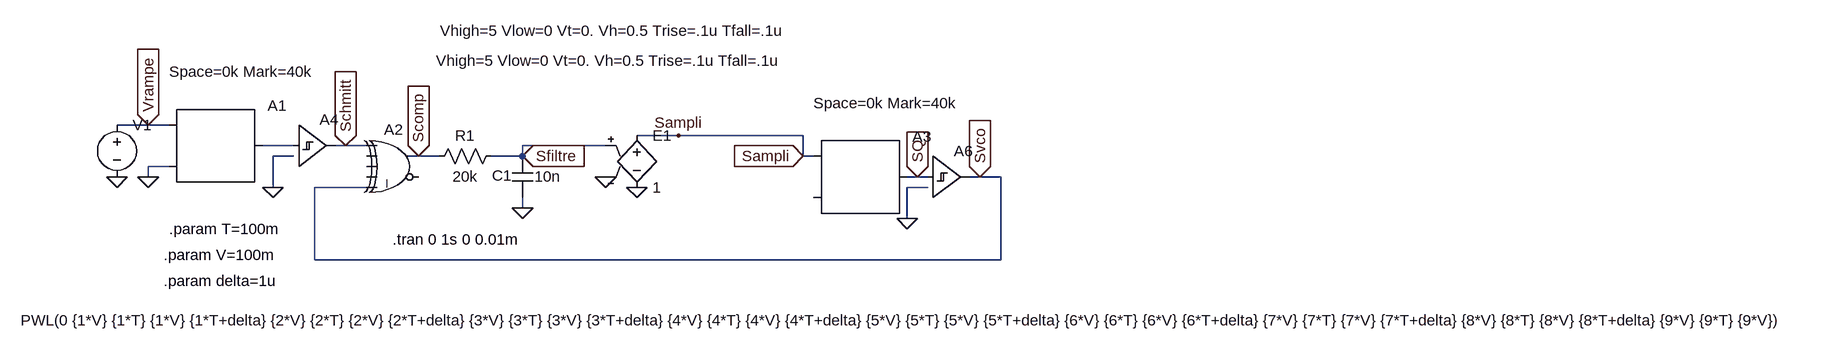
[diagram p0: schematic DQ16Rampe de tension discrete.asc]
DQ16Rampe de tension discrete.asc, the LTspice schematic file:
Version 4.1
SHEET 1 3036 680
WIRE -272 48 -320 48
WIRE -240 48 -272 48
WIRE 544 64 480 64
WIRE 736 64 544 64
WIRE -48 80 -96 80
WIRE 32 80 16 80
WIRE 64 80 32 80
WIRE 432 80 304 80
WIRE -48 96 -80 96
WIRE 144 96 128 96
WIRE 176 96 144 96
WIRE 304 96 304 80
WIRE 304 96 256 96
WIRE 736 96 736 64
WIRE 752 96 736 96
WIRE -240 112 -272 112
WIRE -272 128 -272 112
WIRE 912 128 896 128
WIRE 928 128 912 128
WIRE 1008 128 992 128
WIRE 1040 128 1008 128
WIRE -80 144 -80 96
WIRE 64 144 -16 144
WIRE 928 144 896 144
WIRE 304 176 304 160
WIRE 896 192 896 144
WIRE -16 256 -16 144
WIRE 1040 256 1040 128
WIRE 1040 256 -16 256
FLAG 304 176 0
FLAG -320 128 0
FLAG -272 48 Vrampe
IOPIN -272 48 In
FLAG 304 96 Sfiltre
IOPIN 304 96 In
FLAG 144 96 Scomp
IOPIN 144 96 In
FLAG 1008 128 Svco
IOPIN 1008 128 In
FLAG 432 128 0
FLAG 480 144 0
FLAG 544 64 Sampli
FLAG 896 192 0
FLAG 736 96 Sampli
IOPIN 736 96 In
FLAG 912 128 SQ
IOPIN 912 128 In
FLAG -80 144 0
FLAG -272 128 0
FLAG 32 80 Schmitt
IOPIN 32 80 In
SYMBOL res 272 80 R90
WINDOW 0 0 56 VBottom 2
WINDOW 3 32 56 VTop 2
SYMATTR InstName R1
SYMATTR Value 20k
SYMBOL cap 288 96 R0
WINDOW 0 -31 30 Left 2
WINDOW 3 35 31 Left 2
SYMATTR InstName C1
SYMATTR Value 10n
SYMBOL Digital\\xor 112 48 R0
WINDOW 0 -21 7 Left 2
SYMATTR InstName A2
SYMBOL SpecialFunctions\\modulate 752 96 R0
WINDOW 3 0 -82 Left 2
SYMATTR Value Space=0k Mark=40k
SYMATTR InstName A3
SYMBOL Digital\\schmtbuf 928 64 R0
WINDOW 3 -751 -161 Left 2
SYMATTR Value Vhigh=5 Vlow=0 Vt=0. Vh=0.5 Trise=.1u Tfall=.1u
SYMATTR InstName A6
SYMBOL voltage -320 32 R0
WINDOW 3 -148 317 Left 2
WINDOW 123 0 0 Left 0
WINDOW 39 0 0 Left 0
SYMATTR Value PWL(0 {1*V} {1*T} {1*V} {1*T+delta} {2*V} {2*T} {2*V} {2*T+delta} {3*V} {3*T} {3*V} {3*T+delta} {4*V} {4*T} {4*V} {4*T+delta} {5*V} {5*T} {5*V} {5*T+delta} {6*V} {6*T} {6*V} {6*T+delta} {7*V} {7*T} {7*V} {7*T+delta} {8*V} {8*T} {8*V} {8*T+delta} {9*V} {9*T} {9*V})
SYMATTR InstName V1
SYMBOL e 480 48 R0
SYMATTR InstName E1
SYMATTR Value 1
SYMBOL SpecialFunctions\\modulate -240 48 R0
WINDOW 3 0 -82 Left 2
SYMATTR Value Space=0k Mark=40k
SYMATTR InstName A1
SYMBOL Digital\\schmtbuf -48 16 R0
WINDOW 3 219 -67 Left 2
SYMATTR Value Vhigh=5 Vlow=0 Vt=0. Vh=0.5 Trise=.1u Tfall=.1u
SYMATTR InstName A4
TEXT 104 224 Left 2 !.tran 0 1s 0 0.01m
TEXT -240 208 Left 2 !.param T=100m
TEXT -248 248 Left 2 !.param V=100m
TEXT -248 288 Left 2 !.param delta=1u

The netlist it stands for:
* DQ16Rampe de tension discrete.asc
R1 Sfiltre Scomp 20k
C1 Sfiltre 0 10n
A2 Schmitt 0 0 0 Svco 0 Scomp 0 XOR
A3 Sampli 0 0 0 0 0 SQ 0 MODULATOR Space=0k Mark=40k
A6 SQ 0 0 0 0 0 Svco 0 SCHMITT Vhigh=5 Vlow=0 Vt=0. Vh=0.5 Trise=.1u Tfall=.1u
V1 Vrampe 0 PWL(0 {1*V} {1*T} {1*V} {1*T+delta} {2*V} {2*T} {2*V} {2*T+delta} {3*V} {3*T} {3*V} {3*T+delta} {4*V} {4*T} {4*V} {4*T+delta} {5*V} {5*T} {5*V} {5*T+delta} {6*V} {6*T} {6*V} {6*T+delta} {7*V} {7*T} {7*V} {7*T+delta} {8*V} {8*T} {8*V} {8*T+delta} {9*V} {9*T} {9*V})
E1 Sampli 0 Sfiltre 0 1
A1 Vrampe 0 0 0 0 0 N001 0 MODULATOR Space=0k Mark=40k
A4 N001 0 0 0 0 0 Schmitt 0 SCHMITT Vhigh=5 Vlow=0 Vt=0. Vh=0.5 Trise=.1u Tfall=.1u
.tran 0 1s 0 0.01m
.param T=100m
.param V=100m
.param delta=1u
.backanno
.end